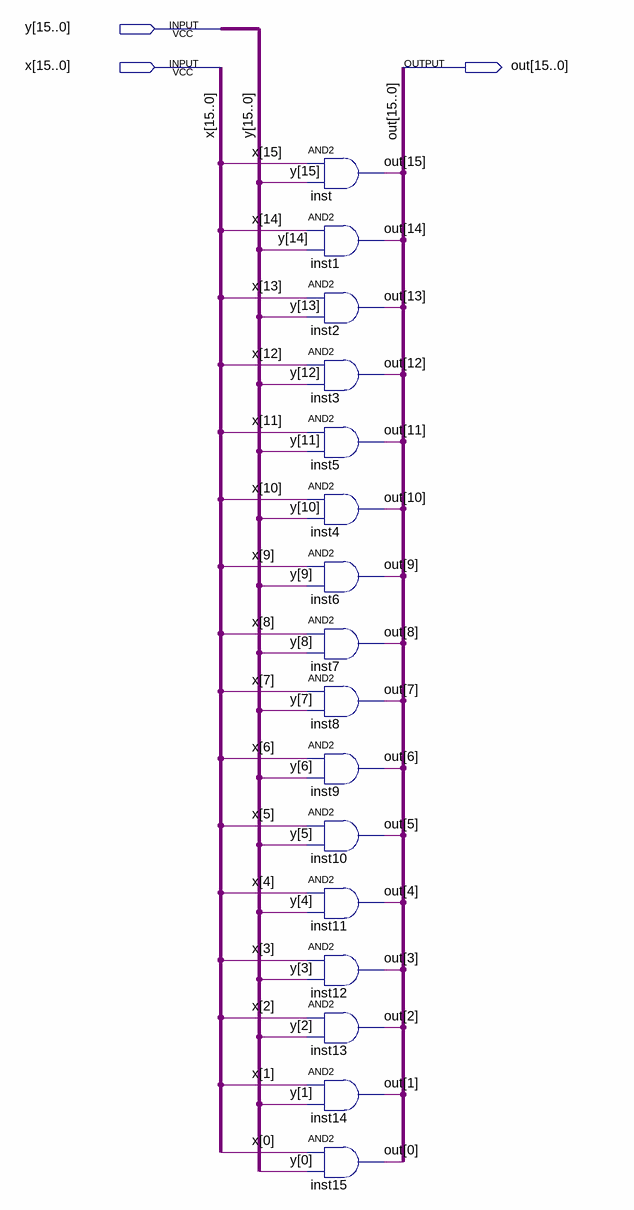
[diagram p0: schematic sheet]
// Quartus schematic andw16.bdf as structural Verilog: 16 symbols, 3 pins
module andw16 (
  input  [15:0] y,
  input  [15:0] x,
  output [15:0] out
);

  and inst (out[15], x[15], y[15]);
  and inst1 (out[14], x[14], y[14]);
  and inst2 (out[13], x[13], y[13]);
  and inst3 (out[12], x[12], y[12]);
  and inst5 (out[11], x[11], y[11]);
  and inst4 (out[10], x[10], y[10]);
  and inst6 (out[9], x[9], y[9]);
  and inst7 (out[8], x[8], y[8]);
  and inst8 (out[7], x[7], y[7]);
  and inst9 (out[6], x[6], y[6]);
  and inst10 (out[5], x[5], y[5]);
  and inst11 (out[4], x[4], y[4]);
  and inst12 (out[3], x[3], y[3]);
  and inst13 (out[2], x[2], y[2]);
  and inst14 (out[1], x[1], y[1]);
  and inst15 (out[0], x[0], y[0]);
endmodule
